# EAGLE design mcp23017 (EAGLE 6.5.0)
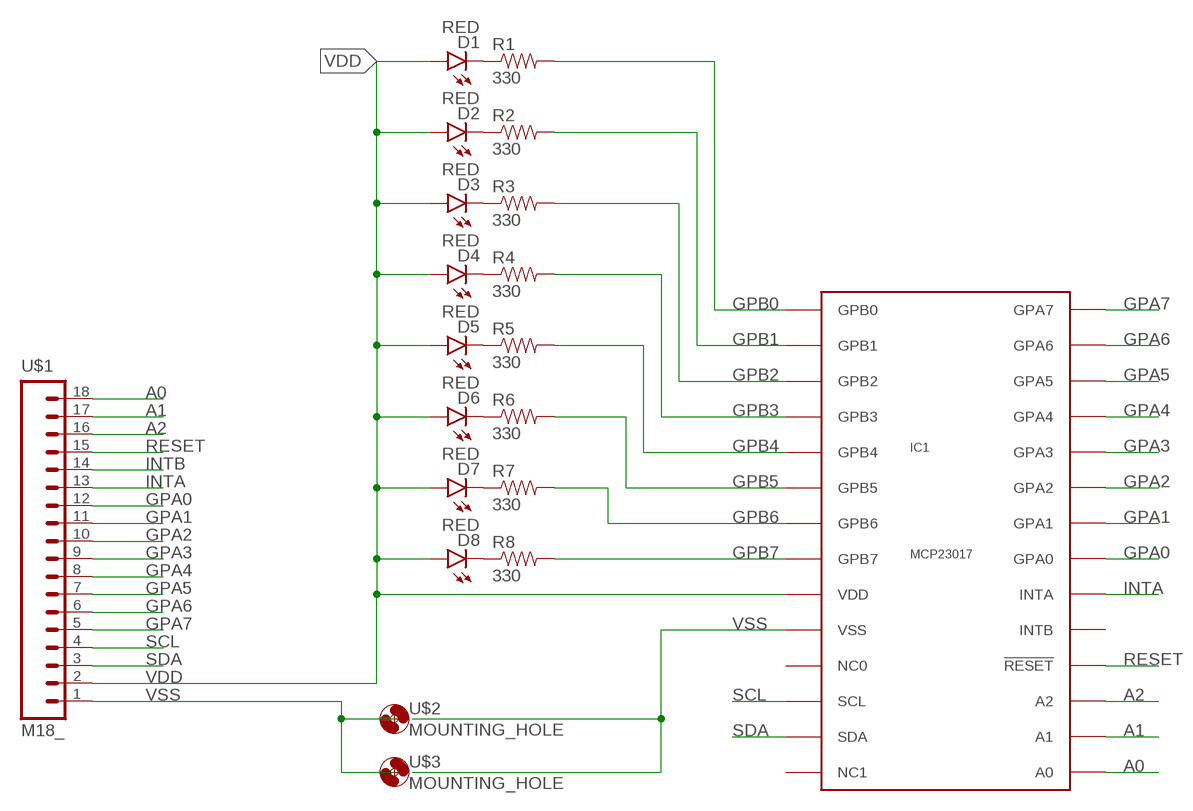
[diagram p0: schematic, sheet 1]

## Parts
D1  RED  LED-RED0603  [LED-0603]
D2  RED  LED-RED0603  [LED-0603]
D3  RED  LED-RED0603  [LED-0603]
D4  RED  LED-RED0603  [LED-0603]
D5  RED  LED-RED0603  [LED-0603]
D6  RED  LED-RED0603  [LED-0603]
D7  RED  LED-RED0603  [LED-0603]
D8  RED  LED-RED0603  [LED-0603]
IC1  MCP23017  [SSOP-28]
R1  330  330OHM1/10W1%(0603)  [0603-RES]
R2  330  330OHM1/10W1%(0603)  [0603-RES]
R3  330  330OHM1/10W1%(0603)  [0603-RES]
R4  330  330OHM1/10W1%(0603)  [0603-RES]
R5  330  330OHM1/10W1%(0603)  [0603-RES]
R6  330  330OHM1/10W1%(0603)  [0603-RES]
R7  330  330OHM1/10W1%(0603)  [0603-RES]
R8  330  330OHM1/10W1%(0603)  [0603-RES]
U$1  M18_  [1X18]
U$2  MOUNTING_HOLE  [MOUNTING_HOLE]
U$3  MOUNTING_HOLE  [MOUNTING_HOLE]

## Nets
A0: IC1.15(A0) U$1.18
A1: IC1.16(A1) U$1.17
A2: IC1.17(A2) U$1.16
GPA0: IC1.21(GPA0) U$1.12
GPA1: IC1.22(GPA1) U$1.11
GPA2: IC1.23(GPA2) U$1.10
GPA3: IC1.24(GPA3) U$1.9
GPA4: IC1.25(GPA4) U$1.8
GPA5: IC1.26(GPA5) U$1.7
GPA6: IC1.27(GPA6) U$1.6
GPA7: IC1.28(GPA7) U$1.5
GPB0: IC1.1(GPB0) R1.2
GPB1: IC1.2(GPB1) R2.2
GPB2: IC1.3(GPB2) R3.2
GPB3: IC1.4(GPB3) R4.2
GPB4: IC1.5(GPB4) R5.2
GPB5: IC1.6(GPB5) R6.2
GPB6: IC1.7(GPB6) R7.2
GPB7: IC1.8(GPB7) R8.2
INTA: IC1.20(INTA) U$1.13
INTB: U$1.14
N$4: D1.C R1.1
N$5: D2.C R2.1
N$6: D3.C R3.1
N$7: D4.C R4.1
N$8: D5.C R5.1
N$9: D6.C R6.1
N$10: D7.C R7.1
N$11: D8.C R8.1
RESET: IC1.18(!RESET!) U$1.15
SCL: IC1.12(SCL) U$1.4
SDA: IC1.13(SDA) U$1.3
VDD: D1.A D2.A D3.A D4.A D5.A D6.A D7.A D8.A IC1.9(VDD) U$1.2
VSS: IC1.10(VSS) U$1.1 U$2.GND U$3.GND
Unconnected: IC1.11(NC0) IC1.14(NC1) IC1.19(INTB)

## Library data of the parts
D1-D8 = SparkFun-LED:LED-RED: Assorted Red LEDs LilyPad 1206- DIO-09912 1206- DIO-00809 0603- DIO-00819; PROD_ID: DIO-00819
IC1 = RoboJackets-ICs:MCP23017
R1-R8 = SparkFun-Resistors:330OHM1/10W1%(0603): RES-00818; PROD_ID: RES-00818
U$1 = SparkFun-Connectors:M18: 1x18 .1" header
U$2 U$3 = RoboJackets-Passive:MOUNTING_HOLE

## Board
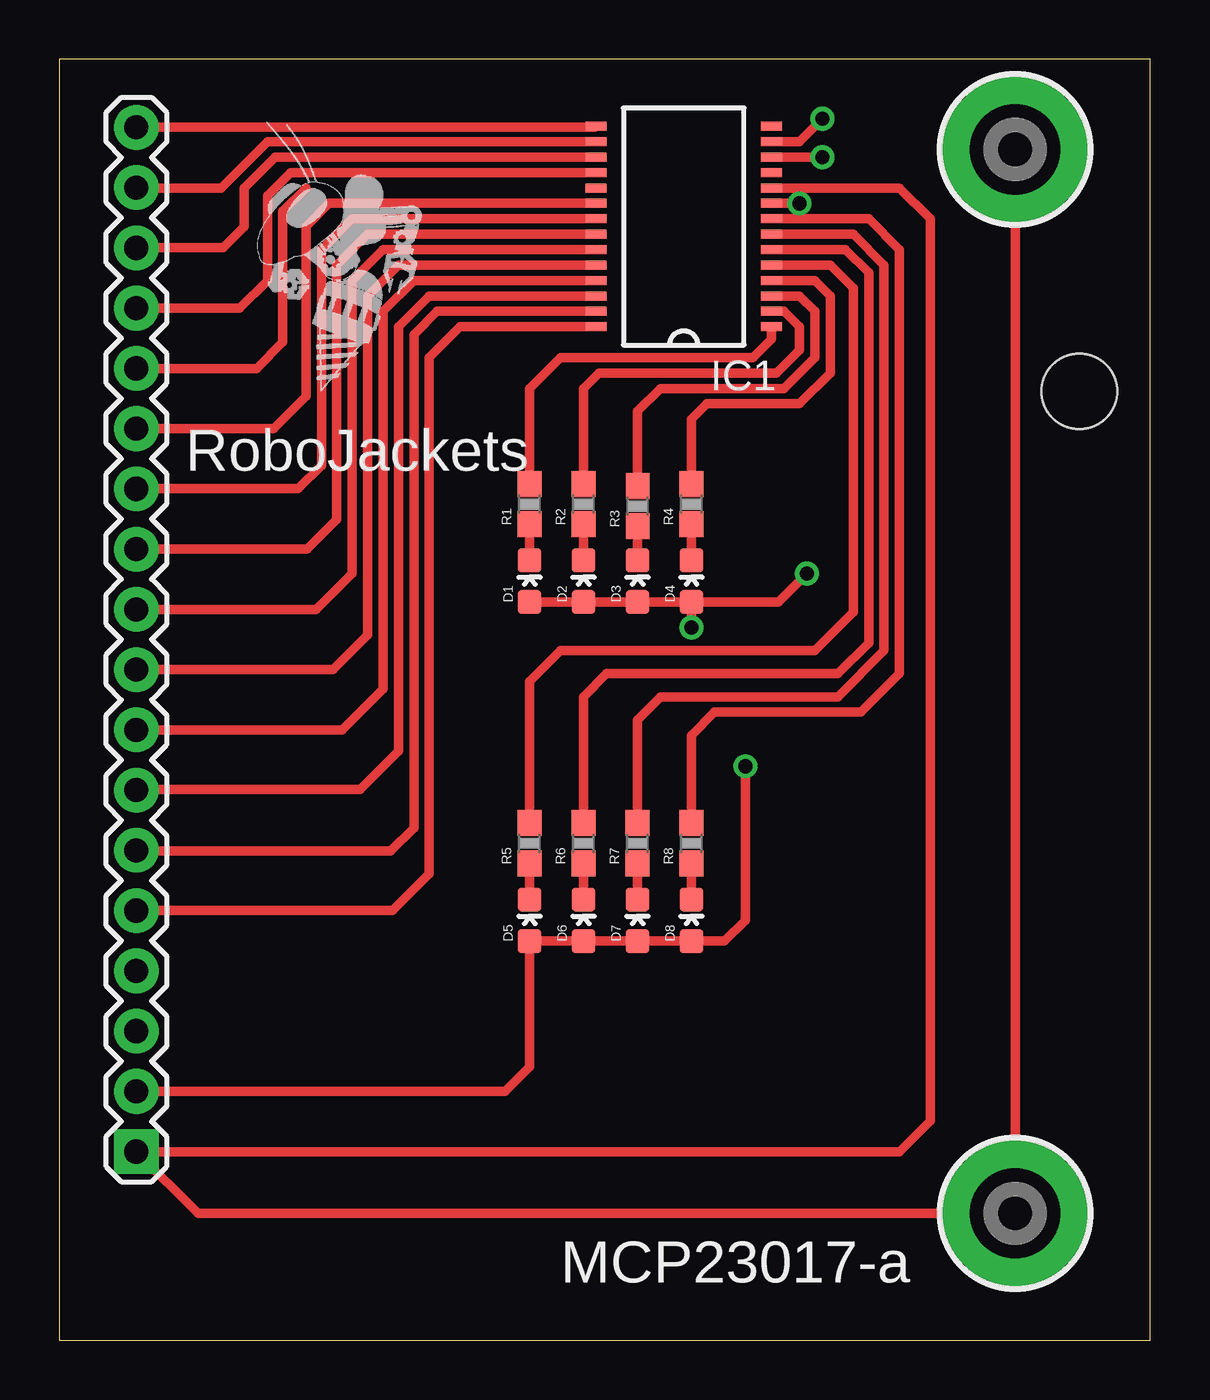
[diagram p1: board, top side]
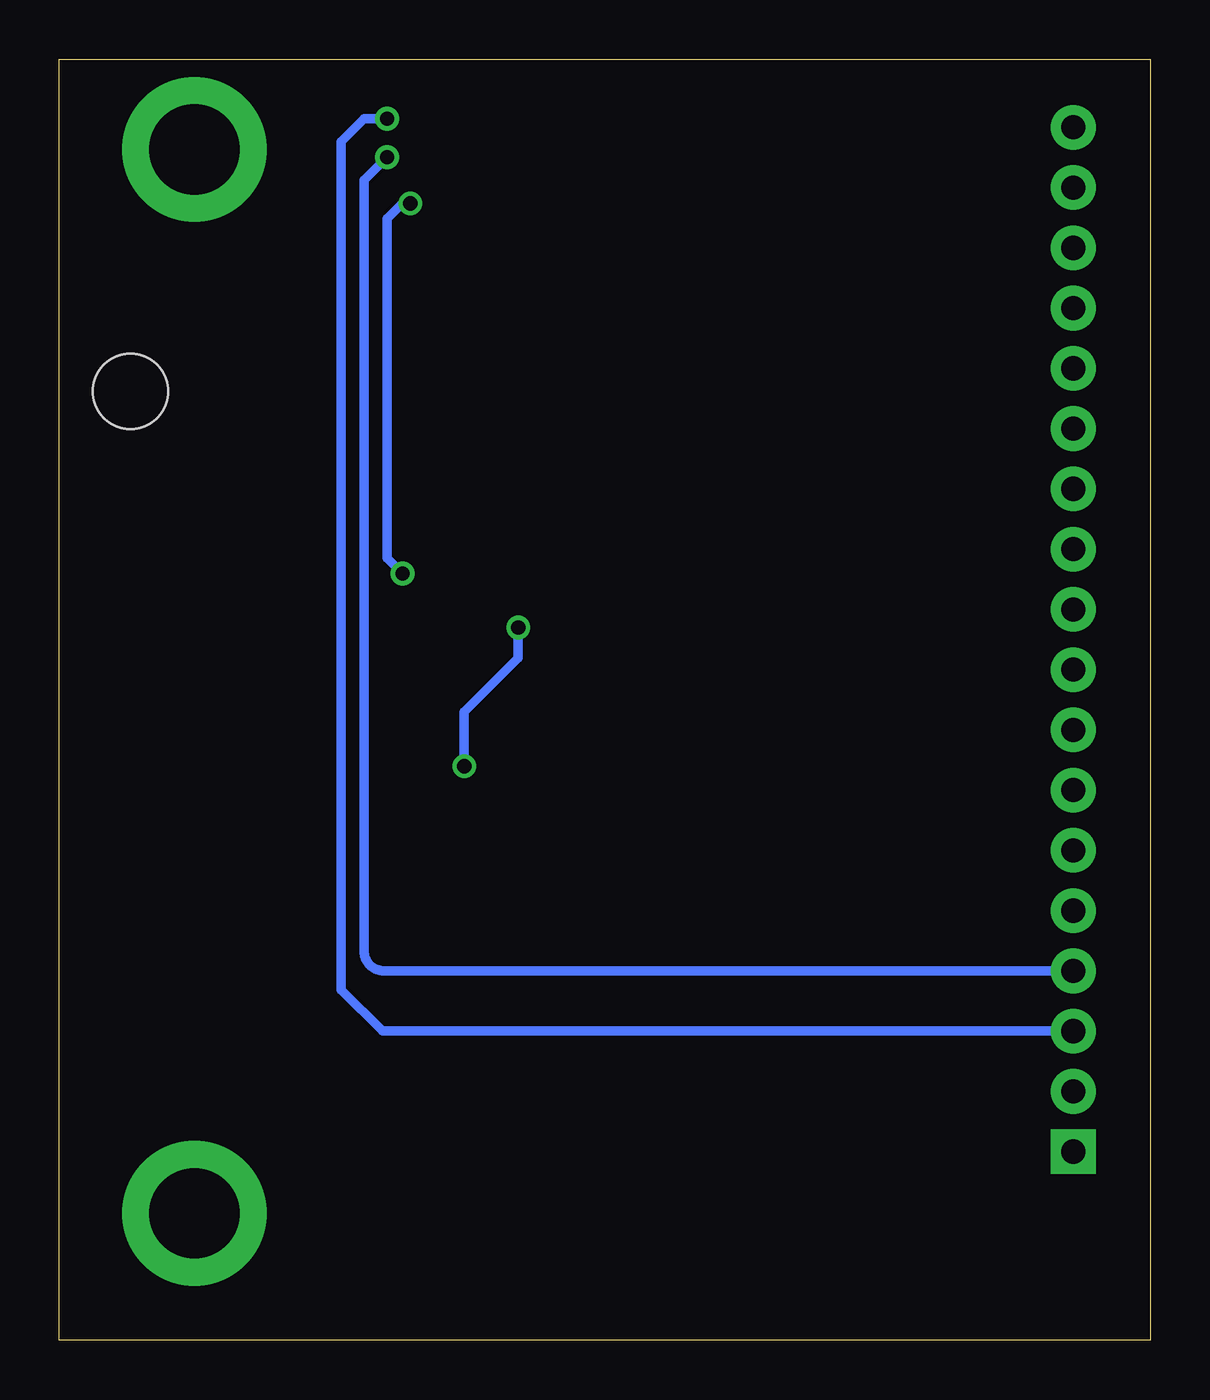
[diagram p2: board, bottom side, seen from below]

Size 46 x 54 mm. Coordinates in mm from the lower left corner, seen from the top.
Outline: 0,0 46,0 46,54 0,54 0,0
Copper layers (1*16): Top 0.035mm / dielectric 1.5mm / Bottom 0.035mm
Design rules "default": minimum track width 10mil, minimum drill 24mil, track to track 8mil, track to pad 8mil, pad to pad 8mil, via to via 8mil, smd to smd 8mil, copper to edge 40mil, drill to drill 8mil, minimum pad ring 10mil, minimum via ring 8mil, stop-mask expansion 4mil, vias tented up to drill 0mil, thermal gap 10mil
Holes 3.17 mm at 43,40

### Footprints (pad centres in the part's own frame; a part is rotated, then mirrored left to right if it is on the bottom)
LED-0603 = smd 1 x 1: A 0,-0.877; C 0,0.877
SSOP-28 = smd 0.9 x 0.38: 1 -3.7,4.225; 2 -3.7,3.575; 3 -3.7,2.925; 4 -3.7,2.275; 5 -3.7,1.625; 6 -3.7,0.975; 7 -3.7,0.325; 8 -3.7,-0.325; 9 -3.7,-0.975; 10 -3.7,-1.625; 11 -3.7,-2.275; 12 -3.7,-2.925; 13 -3.7,-3.575; 14 -3.7,-4.225; 15 3.7,-4.225; 16 3.7,-3.575; 17 3.7,-2.925; 18 3.7,-2.275; 19 3.7,-1.625; 20 3.7,-0.975; 21 3.7,-0.325; 22 3.7,0.325; 23 3.7,0.975; 24 3.7,1.625; 25 3.7,2.275; 26 3.7,2.925; 27 3.7,3.575; 28 3.7,4.225
0603-RES = smd 1.1 x 1: 1 -0.85,0; 2 0.85,0
1X18 = drill 1.016 pad 1.88 square: 1 0,0 | drill 1.016 pad 1.88: 2 2.54,0; 3 5.08,0; 4 7.62,0; 5 10.16,0; 6 12.7,0; 7 15.24,0; 8 17.78,0; 9 20.32,0; 10 22.86,0; 11 25.4,0; 12 27.94,0; 13 30.48,0; 14 33.02,0; 15 35.56,0; 16 38.1,0; 17 40.64,0; 18 43.18,0
MOUNTING_HOLE = drill 3.81 pad 6.096: GND 0,0

### Placement (x,y rotation side)
D1  19.82,32 0 top
D2  22.1,32 0 top
D3  24.38,32 0 top
D4  26.65,32 0 top
D5  19.82,17.7 0 top
D6  22.1,17.7 0 top
D7  24.38,17.7 0 top
D8  26.65,17.7 0 top
IC1  26.32,46.95 180 top
R1  19.82,35.25 90 top
R2  22.1,35.25 90 top
R3  24.39,35.16 90 top
R4  26.65,35.25 90 top
R5  19.82,20.95 90 top
R6  22.1,20.95 90 top
R7  24.38,20.95 90 top
R8  26.65,20.95 90 top
U$1  3.25,7.95 90 top
U$2  40.3,5.35 0 top
U$3  40.3,50.2 0 top
U$4  [ROBOBUZZ_0.6X]  11,40 0 top

### Tracks (layer width: path | path; a pad name or v marks a point on that pad's centre or on a via)
A0
  Top 0.406: U$1.18 22.58,51.13 IC1.15
A1
  Top 0.406: IC1.16 8.78,50.52 6.83,48.58 3.27,48.58 U$1.17
A2
  Top 0.406: IC1.17 9.1,49.88 7.8,48.58 7.8,46.95 6.9,46.05 U$1.16
GPA0
  Top 0.406: IC1.21 12.35,47.27 11.05,45.98 11.05,36.88 10.07,35.9 U$1.12
GPA1
  Top 0.406: IC1.22 13,46.62 11.7,45.33 11.7,34.6 10.45,33.35 U$1.11
GPA2
  Top 0.406: IC1.23 13.65,45.98 12.35,44.67 12.35,32.33 10.84,30.81 U$1.10
GPA3
  Top 0.406: IC1.24 14.3,45.33 13,44.02 13,29.73 11.54,28.27 U$1.9
GPA4
  Top 0.406: IC1.25 14.95,44.67 13.65,43.38 13.65,27.45 11.93,25.73 U$1.8
GPA5
  Top 0.406: IC1.26 15.6,44.02 14.3,42.73 14.3,24.85 12.68,23.23 3.29,23.23 U$1.7
GPA6
  Top 0.406: IC1.27 15.93,43.38 14.95,42.4 14.95,21.6 13.97,20.62 3.27,20.62 U$1.6
GPA7
  Top 0.406: IC1.28 16.9,42.73 15.6,41.42 15.6,19.65 14.06,18.11 U$1.5
GPB0
  Top 0.406: R1.2 19.82,40.12 21.12,41.42 29.25,41.42 30.02,42.2 IC1.1
GPB1
  Top 0.406: R2.2 22.1,40.12 22.75,40.77 30.23,40.77 31.2,41.75 31.2,42.73 30.55,43.38 IC1.2
GPB2
  Top 0.406: R3.2 24.39,39.16 25.35,40.12 30.55,40.12 31.85,41.42 31.85,43.38 31.2,44.02 IC1.3
GPB3
  Top 0.406: R4.2 26.65,38.83 27.3,39.48 31.2,39.48 32.5,40.77 32.5,44.02 31.85,44.67 IC1.4
GPB4
  Top 0.406: R5.2 19.82,27.77 21.12,29.07 31.85,29.07 33.48,30.7 33.48,44.35 32.5,45.33 IC1.5
GPB5
  Top 0.406: R6.2 22.1,27.12 23.07,28.1 32.83,28.1 34.12,29.4 34.12,45 33.15,45.98 IC1.6
GPB6
  Top 0.406: R7.2 24.38,26.15 25.35,27.12 32.83,27.12 34.77,29.07 34.77,45.33 33.48,46.62 IC1.7
GPB7
  Top 0.406: R8.2 26.65,25.5 27.62,26.48 33.8,26.48 35.42,28.1 35.42,45.98 34.12,47.27 IC1.8
INTA
  Top 0.406: IC1.20 11.38,47.92 10.4,46.95 10.4,39.8 9.03,38.43 U$1.13
INTB
  Top 0.406: 10.4,48.58 9.43,47.6 9.43,42.08 8.32,40.97 U$1.14
N$4
  Top 0.406: D1.C R1.1
N$5
  Top 0.406: D2.C R2.1
N$6
  Top 0.406: D3.C 24.38,34.3 R3.1
N$7
  Top 0.406: D4.C R4.1
N$8
  Top 0.406: D5.C R5.1
N$9
  Top 0.406: D6.C R6.1
N$10
  Top 0.406: D7.C R7.1
N$11
  Top 0.406: D8.C R8.1
RESET
  Top 0.406: IC1.18 9.75,49.23 8.78,48.25 8.78,44.67 7.61,43.51 U$1.15
SCL  (via drill 0.6)
  Top 0.406: IC1.12 v32.17,49.88
  Bottom 0.406: v32.17,49.88 33.15,48.9 33.15,16.4 arc-90 32.32,15.57 U$1.4
SDA  (via drill 0.6)
  Top 0.406: IC1.13 31.2,50.52 v32.17,51.5
  Bottom 0.406: v32.17,51.5 33.15,51.5 34.12,50.52 34.12,14.78 32.38,13.03 U$1.3
VDD  (via drill 0.6)
  Top 0.406: U$1.2 18.79,10.49 19.82,11.53 D5.A D6.A D7.A D8.A 28.05,16.82 28.93,17.7 v28.93,24.2 | D4.A D3.A D2.A D1.A | IC1.9 v31.2,47.92 | v31.52,32.33 30.32,31.12 D4.A | D4.A v26.65,30.05
  Bottom 0.406: v31.2,47.92 31.52,47.92 32.17,47.27 32.17,32.98 v31.52,32.33 | v26.65,30.05 26.65,28.75 28.93,26.48 v28.93,24.2
VSS
  Top 0.406: IC1.10 35.42,48.58 36.73,47.27 36.73,9.25 35.42,7.95 U$1.1 5.85,5.35 U$2.GND U$3.GND

### Text on the board
tPlace: RoboJackets | MCP23017-a